# EasyEDA Pro project ProPrj_omb-2024-nano_2026-02-09.epro, board PCB1_5
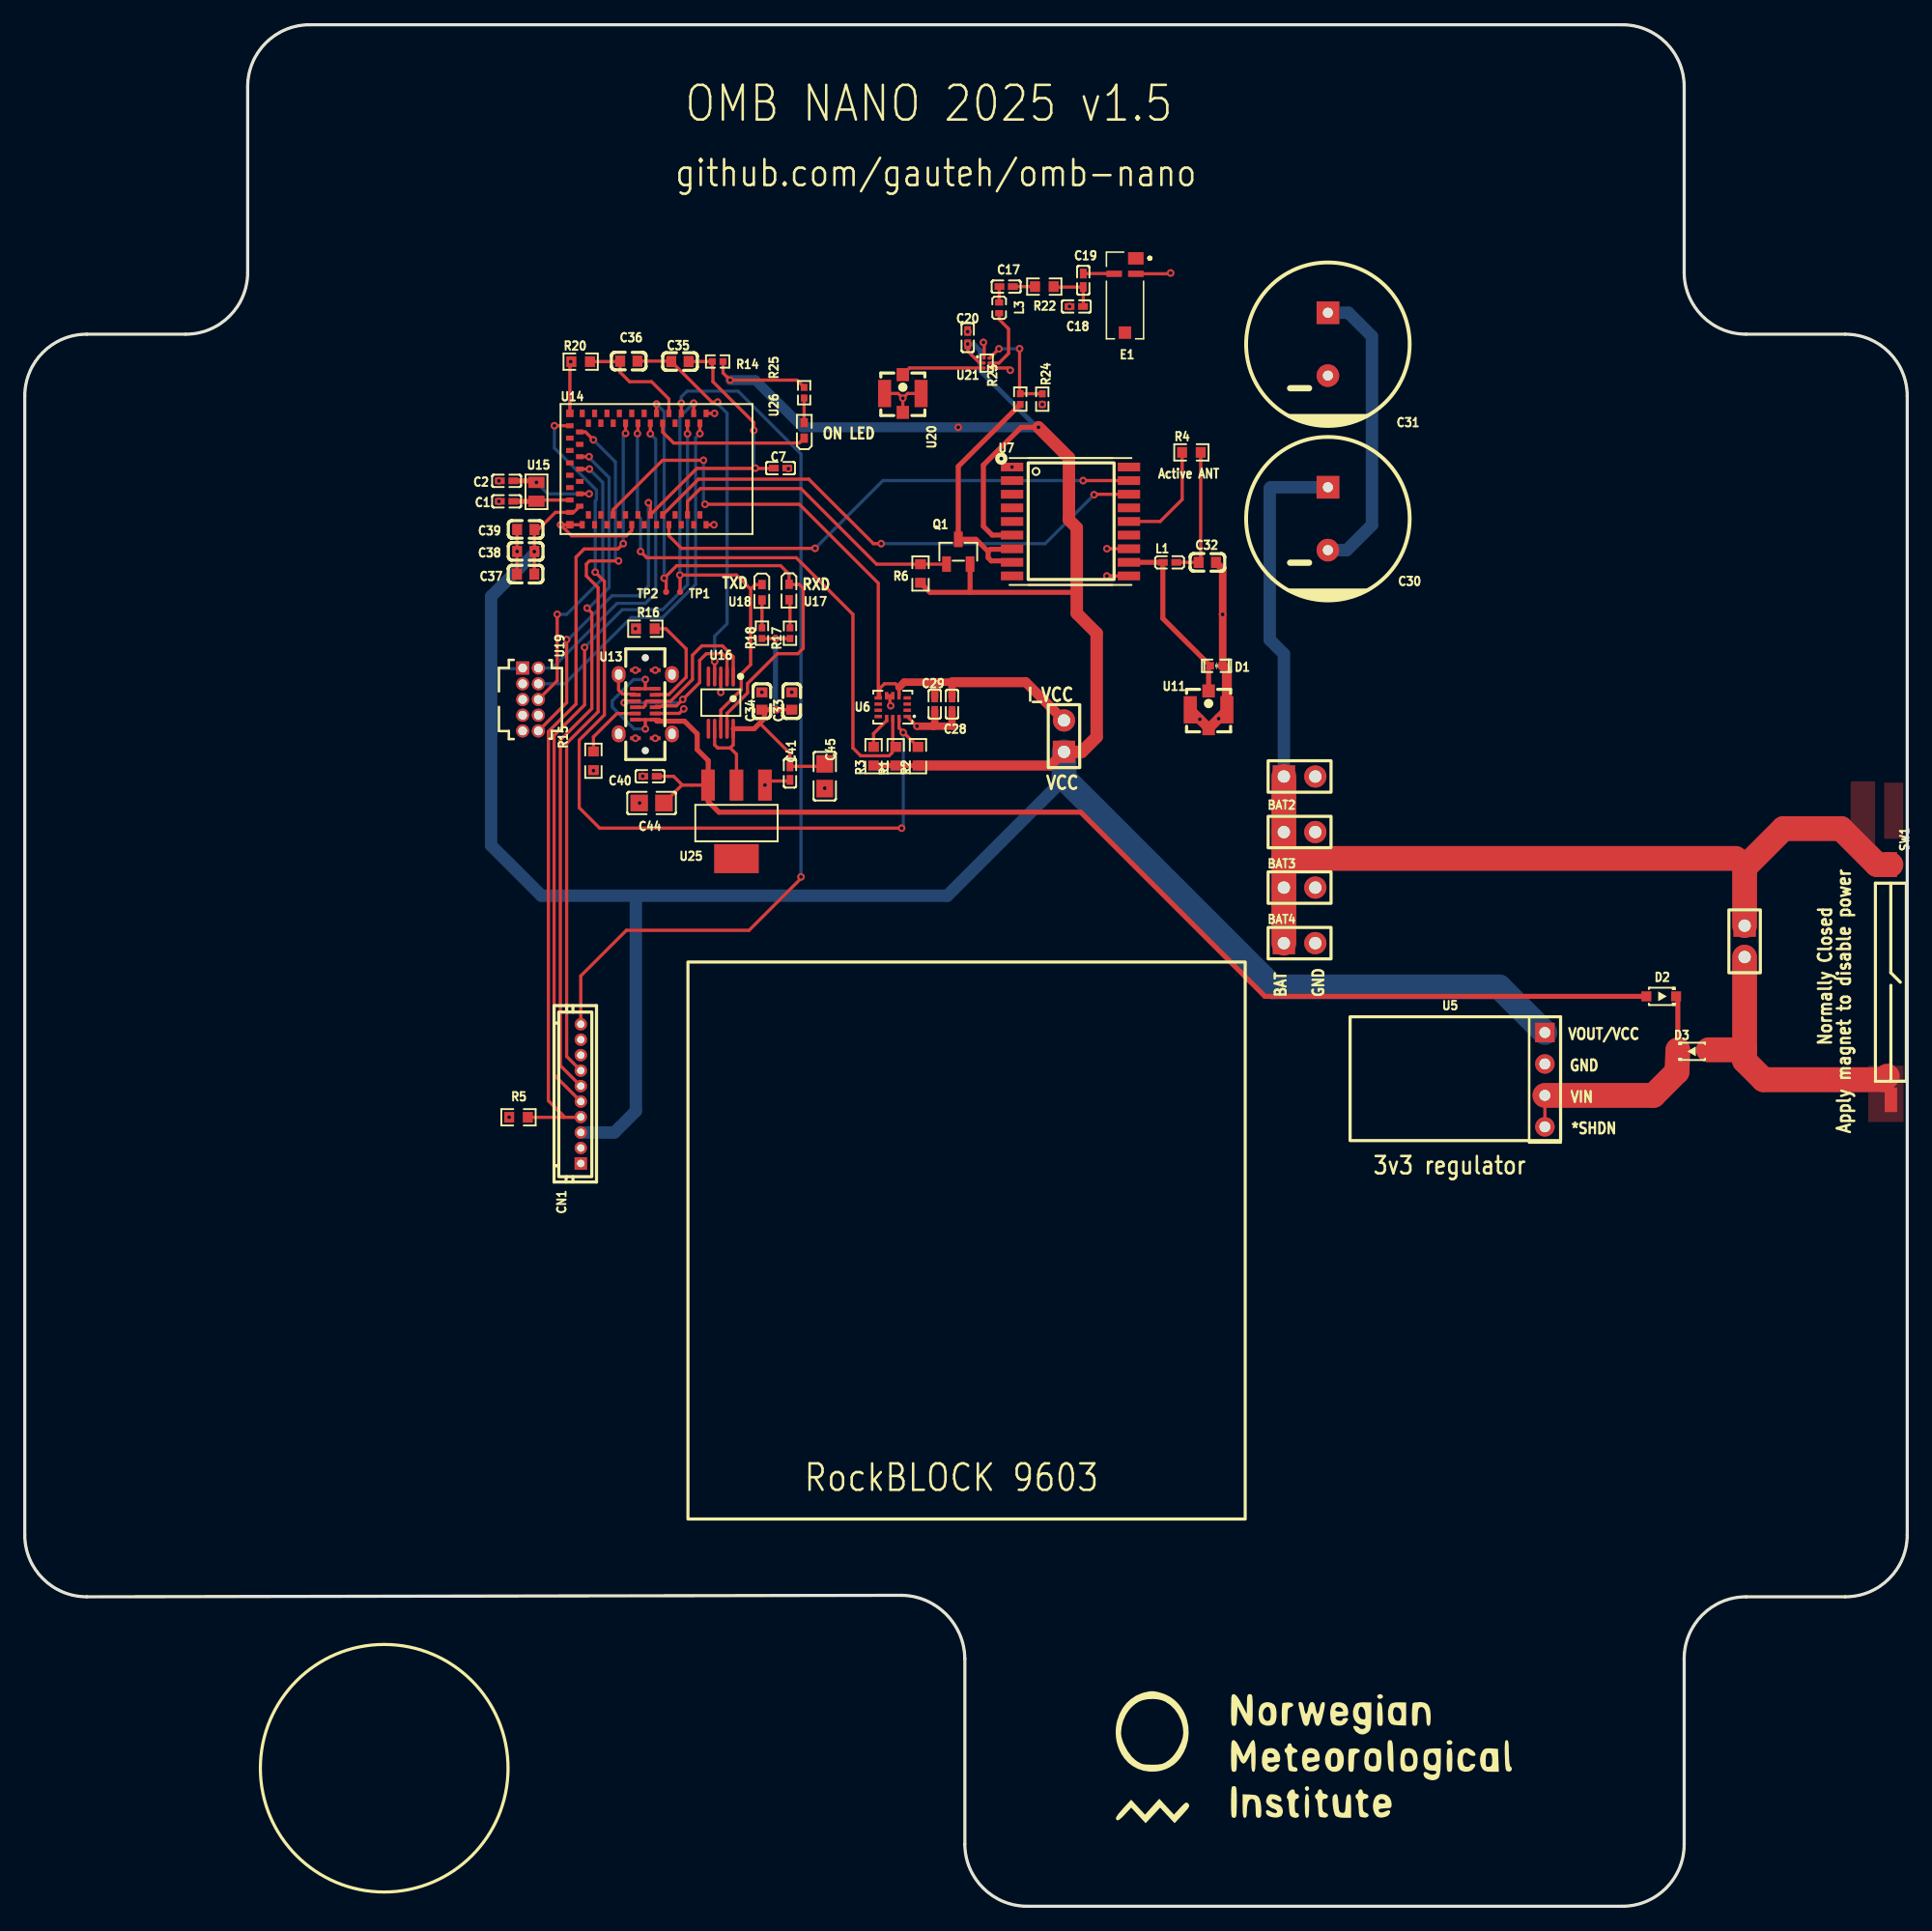
[diagram p19: board, top side]
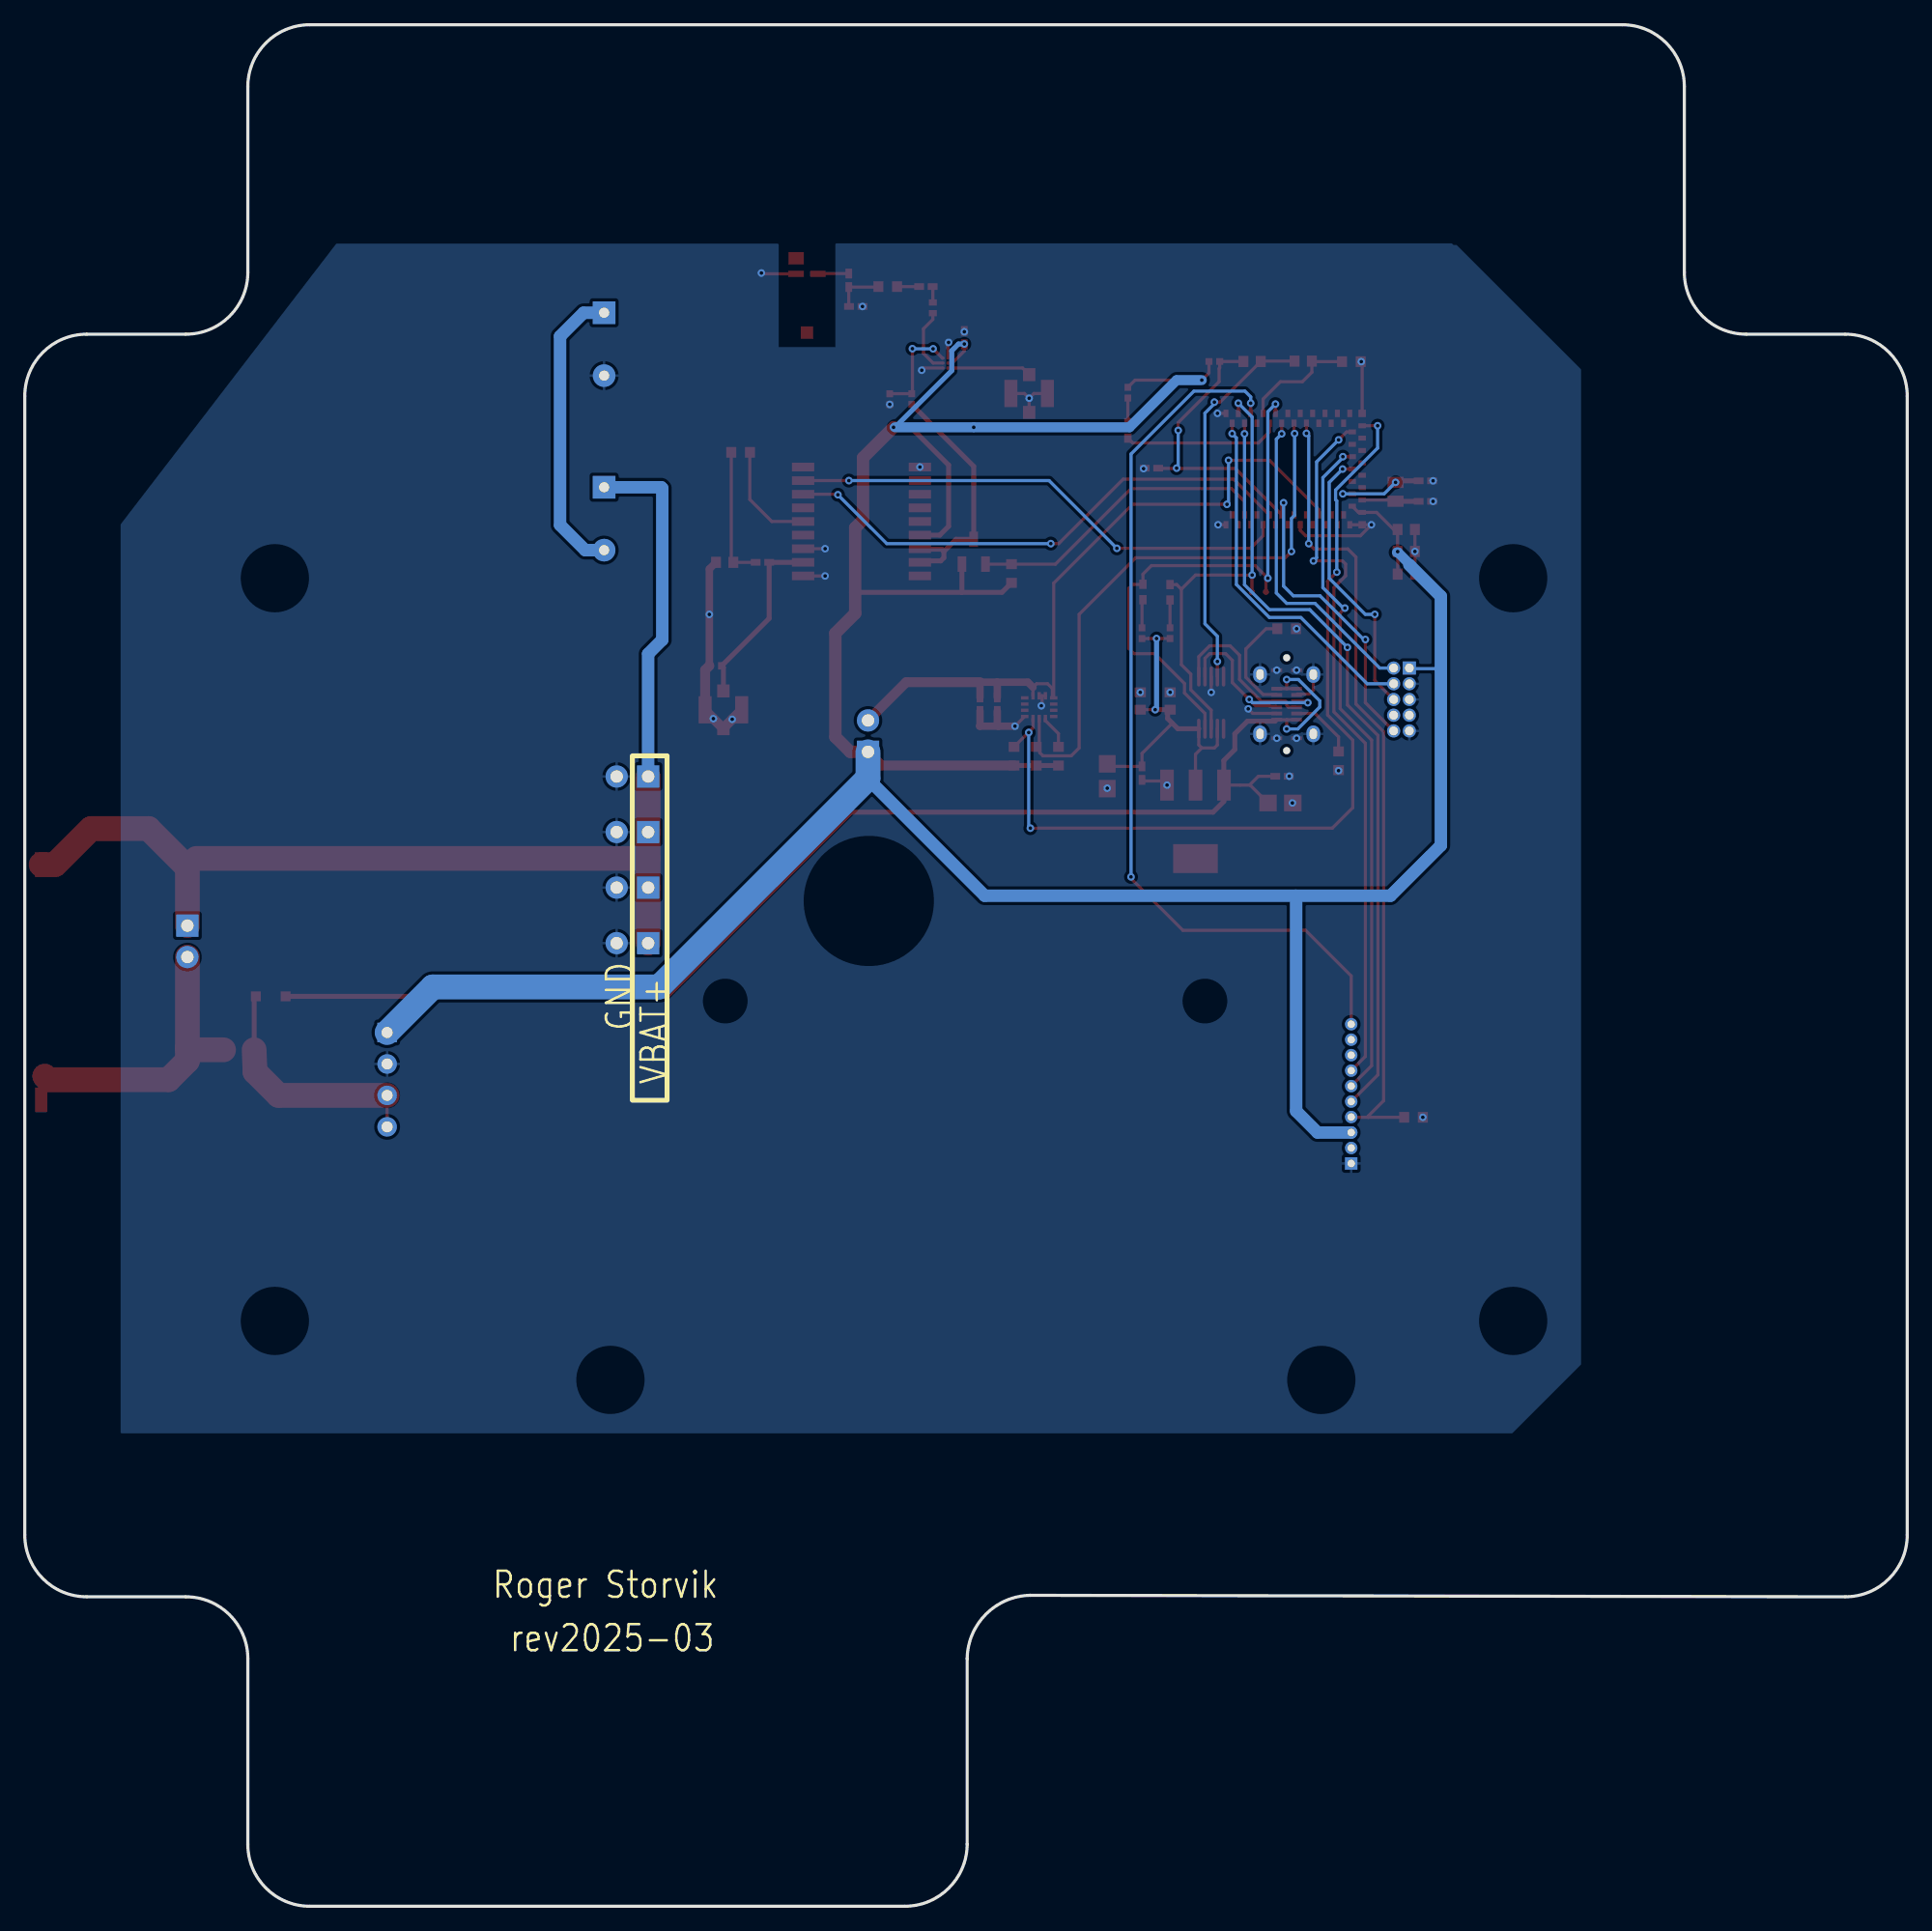
[diagram p20: board, bottom side, seen from below]

Outline 152.01 x 152 mm; copper layers: Top Layer, Bottom Layer. Coordinates in mm from the lower left corner of the outline.
Outline path: 0,122 arc(1.46,125.54) 5,127 13,127 arc(16.54,128.46) 18,132 18,147 arc(19.46,150.54) 23,152 129,152 arc(132.54,150.54) 134,147 134,132 arc(135.46,128.46) 139,127 147.01,127 arc(150.55,125.54) 152.01,122 152.01,30 arc(150.55,26.46) 147.01,25 139,25 arc(135.46,23.54) 134,20 134,5 arc(132.54,1.46) 129,0 80.95,0 arc(77.4,1.46) 75.91,5 75.91,20 arc(74.4,23.59) 70.81,25.12 5,25 arc(1.46,26.46) 0,30 0,122
Stack: Top Layer 0.035mm / Dielectric1 1.51mm FR4 er 4.5 / Bottom Layer 0.035mm

## Design rules (mm)
template: JLCPCB Capability(Two Layers Board)
spacing copperThickness1oz (default): track to track 0.102, other pairs 0.152 to 0.3
spacing copperThickness2oz: track to track 0.203, other pairs 0.152 to 0.3
track width copperThickness1oz (default): min 0.127, default 0.254, max 2.54
track width copperThickness2oz: min 0.203, default 0.254, max 2.54
differential pair differentialPair (default): width min 0.127, default 0.254, max 2.54; gap min 0.152, default 0.152
via viaSize (default): diameter min 0.5, default 0.61, max 10; hole min 0.3, default 0.305, max 6.3

## Placement (name value [footprint] x y rotation side)
BAT1  BAT  [HDR-TH_2P-P2.54-V-M-1]  102.94 91.27 0 top
BAT2  BAT  [HDR-TH_2P-P2.54-V-M-1]  102.94 86.78 0 top
BAT3  BAT  [HDR-TH_2P-P2.54-V-M-1]  102.94 82.29 0 top
BAT4  BAT  [HDR-TH_2P-P2.54-V-M-1]  102.94 77.81 0 top
C1  15pF  [C0402]  38.91 113.5 180 top
C2  15pF  [C0402]  38.91 115.16 180 top
C7  1nF  [C0402]  61.03 116.18 180 top
C17  1nF  [C0402]  79.25 130.85 0 top
C18  4.6pF  [C0402]  84.91 129.24 0 top
C19  1.1pF  [C0402]  85.47 131.36 90 top
C20  1uF  [C0402]  76.14 126.72 270 top
C28  100nF  [C0402]  74.88 97.11 270 top
C29  100nF  [C0402]  73.48 97.11 270 top
C30  10F  [CP_12.5X20MM]  105.23 112.1 180 top
C31  10F  [CP_12.5X20MM]  105.23 126.19 180 top
C32  10nF  [C0603]  95.49 108.57 180 top
C33  0.1uF  [C0603]  61.93 97.37 90 top
C34  10nF  [C0603]  59.52 97.37 90 top
C35  0.1uF  [C0603]  52.91 124.8 180 top
C36  0.1uF  [C0603]  48.78 124.83 0 top
C37  10uF  [C0603]  40.45 107.62 0 top
C38  1uF  [C0603]  40.46 109.45 0 top
C39  0.1uF  [C0603]  40.46 111.23 0 top
C40  100nF  [C0402]  50.49 91.29 180 top
C41  100nF  [C0402]  61.79 91.54 270 top
C44  22uF  [C0805]  50.62 89.13 180 top
C45  22uF  [C0805]  64.6 91.29 270 top
CN1  530471010  [CONN-TH_530471010]  44.9 65.63 90 top
D1  PESD0402-240  [D0402-BI]  96.23 100.21 180 top
D2  PMEG4005EJ,115  [SOD-323_L1.7-W1.3-LS2.5-RD]  132.15 73.51 180 top
D3  PMEG4005EJ,115  [SOD-323_L1.7-W1.3-LS2.5-RD]  134.69 69.06 0 top
E1  -  [NN03-320]  88.85 130.13 90 top
IMUBACKUPPWR1  IMU_BACKUP_PWR  [HDR-TH_2P-P2.54-V-M-1]  83.92 94.53 90 top
L1  27nH  [L0402]  92.45 108.57 0 top
L3  7.5nH  [IND-SMD_L1.0-W0.6]  78.68 129.13 90 top
Q1  DMG2305UX-7  [SOT-23-3_L2.9-W1.3-P1.90-LS2.4-BR]  75.38 109.43 270 top
R1  10K  [R0603]  70.33 92.91 270 top
R2  10K  [R0603]  72.13 92.91 270 top
R3  10K  [R0603]  68.54 92.91 270 top
R4  10  [R0603]  94.21 117.46 0 top
R5  10K  [R0603]  39.87 63.74 180 top
R6  10K  [R0603]  72.33 107.67 90 top
R14  100kΩ  [R0402]  55.95 124.8 0 top
R15  5.1K  [R0603]  45.92 92.54 90 top
R16  5.1K  [R0603]  50.11 103.21 0 top
R17  1K  [R0402]  61.79 102.84 270 top
R18  1K  [R0402]  59.53 102.85 270 top
R20  220K  [R0603]  44.89 124.78 0 top
R22  0Ω  [R0603]  82.33 130.85 0 top
R23  200kΩ  [R0402]  80.39 121.76 270 top
R24  100kΩ  [R0402]  82.17 121.75 90 top
R25  1K  [R0402]  62.93 122.28 90 top
SW1  MK15-B-2-OE  [SW-SMD_L16.0-W2.5-P19.5_MK15-B-2-OE]  150.69 74.65 270 top
SWEN1  SW_EN  [HDR-TH_2P-P2.54-V-M-1]  138.88 77.95 270 top
TP1  -  [Test-Point-0.5mm]  52.92 106.18 0 top
TP2  -  [Test-Point-0.5mm]  51.79 106.18 0 top
U5  -  [HDR-F-2.54_1X4]  122.75 66.78 270 top
U6  ISM330DHCXTR  [LGA-14_L3.0-W2.5-P0.50-BR]  70.09 96.87 0 top
U7  MAX-M10M-00B  [COMM-SMD_L10.1-W9.7-P1.10_GT-1110F2-AGGB]  84.45 111.87 0 top
U11  CONMHF1-SMD-G-T  [RF-SMD_CONMHF1-SMD-G-T]  95.6 96.66 0 top
U13  TYPE-C 16PLT-H10.0  [TYPE-C-SMD_USB4120-03-C]  50.11 97.11 90 top
U14  SPARKFUN ARTEMIS BLE MODULE  [ARTEMIS_BLE]  44.02 120.61 0 top
U15  32.768kHz  [CRYSTAL-SMD_L2.0-W1.2]  41.32 114.27 90 top
U16  CH340E  [MSOP-10_L3.0-W3.0-P0.50-LS5.0-BL]  56.21 97.24 180 top
U17  YLED0402G  [LED0402-R-RD]  61.72 106.17 270 top
U18  YLED0402R  [LED0402-R-RD]  59.53 106.15 270 top
U19  FTSH-105-01-F-D-K  [CONN-TH_10P-P1.27_FTSH-105-01-F-D-K]  40.84 97.49 270 top
U20  CONMHF1-SMD-G-T  [RF-SMD_CONMHF1-SMD-G-T]  70.9 122.21 0 top
U21  BGA725L6E6327FTSA1  [TSLP-6_L1.1-W0.7-P0.40-BR]  77.67 124.67 180 top
U25  AMS1117-3.3  [SOT-223-3_L6.5-W3.4-P2.30-LS7.0-BR]  57.47 87.6 90 top
U26  YLED0402G  [LED0402-R-RD]  62.93 119.23 90 top

## Footprints (pads in the part's own frame, mm; a bottom-side part is the same pattern mirrored in y, then rotated)
ARTEMIS_BLE
  rect 0.4x0.6 smd: 1(11,0) 2(10.5,-0.8) 3(10,0) 4(9.5,-0.8) 5(9,0) 6(8.5,-0.8) 7(8,0) 8(7.5,-0.8) 9(7,0) 10(6.5,-0.8) 11(6,0) 12(5.5,-0.8) 13(5,0) 14(4.5,-0.8) 15(4,0) 16(3.5,-0.8) 17(3,0) 18(2.5,-0.8) 19(2,0) 20(1.5,-0.8) 21(1,0) 39(1,-8.999) 40(1.5,-8.2) 41(2,-8.999) 42(2.5,-8.2) 43(3,-8.999) 44(3.5,-8.2) 45(4,-8.999) 46(4.5,-8.2) 47(5,-8.999) 48(5.5,-8.2) 49(6,-8.999) 50(6.5,-8.2) 51(7,-8.999) 52(7.5,-8.2) 53(8,-8.999) 54(8.5,-8.2) 55(9,-8.999) 56(9.5,-8.2) 57(10,-8.999) 58(10.5,-8.2) 59(11,-8.999)
  rect 0.6x0.6 smd: 22(0,0) 38(0,-8.999)
  rect 0.6x0.4 smd: 23(0,-1) 24(0.8,-1.5) 25(0,-2) 26(0.8,-2.5) 27(0,-2.999) 28(0.8,-3.5) 29(0,-3.999) 30(0.8,-4.5) 31(0,-5) 32(0.8,-5.5) 33(0,-6) 34(0.8,-6.5) 35(0,-7) 36(0.8,-7.5) 37(0,-8)
C0402
  rect 0.79x0.54 smd: 1(-0.545,0) 2(0.545,0)
C0603
  rect 0.8x0.9 smd: 1(-0.7,0) 2(0.7,0)
C0805
  rect 1.41x1.35 smd: 1(-1,0) 2(1,0)
COMM-SMD_L10.1-W9.7-P1.10_GT-1110F2-AGGB
  rect 1.8x0.7 smd: 1(-4.718,4.4) 2(-4.718,3.3) 3(-4.718,2.2) 4(-4.718,1.1) 5(-4.718,0) 6(-4.718,-1.1) 7(-4.718,-2.2) 8(-4.718,-3.3) 9(-4.718,-4.4) 10(4.718,-4.4) 11(4.718,-3.3) 12(4.718,-2.2) 13(4.718,-1.1) 14(4.718,0) 15(4.718,1.1) 16(4.718,2.2) 17(4.718,3.3) 18(4.718,4.4)
CONN-TH_10P-P1.27_FTSH-105-01-F-D-K
  rect 1.06x1.06 hole 0.715x0.71: 1(-2.54,-0.635)
  round 1.06 hole 0.715x0.71: 2(-2.54,0.635) 3(-1.27,-0.635) 4(-1.27,0.635) 5(0,-0.635) 6(0,0.635) 7(1.27,-0.635) 8(1.27,0.635) 9(2.54,-0.635) 10(2.54,0.635)
CONN-TH_530471010
  rect 1x1 hole 0.6: 1(-5.625,0)
  round 1 hole 0.6: 2(-4.375,0) 3(-3.125,0) 4(-1.875,0) 5(-0.625,0) 6(0.625,0) 7(1.875,0) 8(3.125,0) 9(4.375,0) 10(5.625,0)
CP_12.5X20MM
  rect 1.829x1.829 hole 0.813: 1(0,-2.54)
  round 1.829 hole 0.813: 2(0,2.54)
CRYSTAL-SMD_L2.0-W1.2
  rect 0.9x1.3 smd: 1(-0.762,0) 2(0.762,0)
D0402-BI
  rect 0.6x0.6 smd: 1(-0.5,0) 2(0.5,0)
HDR-F-2.54_1X4
  rect 1.575x1.575 hole 0.889: 1(-3.81,0)
  round 1.575 hole 0.889: 2(-1.27,0) 3(1.27,0) 4(3.81,0)
HDR-TH_2P-P2.54-V-M-1
  rect 1.8x1.8 hole 1: 1(-1.27,0)
  round 1.8 hole 1: 2(1.27,0)
IND-SMD_L1.0-W0.6
  rect 0.5x0.648 smd: 1(-0.434,0) 2(0.434,0)
L0402
  rect 0.79x0.54 smd: 1(-0.545,0) 2(0.545,0)
LED0402-R-RD
  rect 0.75x0.6 smd: 1(0.623,0) 2(-0.623,0)
LGA-14_L3.0-W2.5-P0.50-BR
  rect 0.6x0.27 smd: 1(1.17,-0.75) 2(1.17,-0.25) 3(1.17,0.25) 4(1.17,0.75) 8(-1.17,0.75) 9(-1.17,0.25) 10(-1.17,-0.25) 11(-1.17,-0.75)
  rect 0.27x0.6 smd: 5(0.5,0.92) 6(0,0.92) 7(-0.5,0.92) 12(-0.5,-0.92) 13(0,-0.92) 14(0.5,-0.92)
MSOP-10_L3.0-W3.0-P0.50-LS5.0-BL
  oval 0.28x1.62 smd: 1(-1,-2.11) 2(-0.5,-2.11) 3(0,-2.11) 4(0.5,-2.11) 5(1,-2.11) 6(1,2.11) 7(0.5,2.11) 8(0,2.11) 9(-0.5,2.11) 10(-1,2.11)
NN03-320
  rect 1x1 smd: 1(-3,0)
  custom 0.5x1.25 smd: 2(1.75,-0.875) 4(1.75,0.875)
  custom 1x1.25 smd: 3(3,-0.875)
R0402
  rect 0.566x0.54 smd: 1(-0.433,0) 2(0.433,0)
R0603
  rect 0.806x0.864 smd: 1(-0.753,0) 2(0.753,0)
RF-SMD_CONMHF1-SMD-G-T
  rect 1x1.05 smd: 1(0,1.525) 4(0,-1.525)
  rect 1.05x2.2 smd: 2(-1.475,0) 3(1.475,0)
SOD-323_L1.7-W1.3-LS2.5-RD
  rect 0.8x0.8 smd: 1(-1.2,0) 2(1.2,0)
SOT-23-3_L2.9-W1.3-P1.90-LS2.4-BR
  rect 1.25x0.7 smd: 1(1,-0.95) 2(1,0.95) 3(-1,0)
SOT-223-3_L6.5-W3.4-P2.30-LS7.0-BR
  rect 2.5x1.1 smd: 1(2.97,-2.3) 2(2.97,0) 3(2.97,2.3)
  rect 2.34x3.6 smd: 4(-2.97,0)
SW-SMD_L16.0-W2.5-P19.5_MK15-B-2-OE
  rect 2x1 smd: 1(-9.5,0) 2(9.5,0)
Test-Point-0.5mm
  round 0.5 smd: 1(0,0)
TSLP-6_L1.1-W0.7-P0.40-BR
  rect 0.2x0.2 smd: 1(0.2,-0.4) 2(0.2,0) 3(0.2,0.4) 4(-0.2,0.4) 5(-0.2,0) 6(-0.2,-0.4)
TYPE-C-SMD_USB4120-03-C
  oval 1.35x1.1 hole 0.85x0.6: 0(-2.4,2.15) 0(-2.4,-2.15) 0(2.4,2.15) 0(2.4,-2.15)
  rect 0.3x0.87 smd: A1(-2.75,0.8) A4(-1.25,0.8) A5(-0.75,0.8) A6(-0.25,0.8) A7(0.25,0.8) A8(0.75,0.8) A9(1.25,0.8) A12(2.75,0.8) B1(2.75,-0.8) B4(1.25,-0.8) B5(0.75,-0.8) B6(0.25,-0.8) B7(-0.25,-0.8) B8(-0.75,-0.8) B9(-1.25,-0.8) B12(-2.75,-0.8)

## Nets
As in the schematic.

Pads without a net: CN1 2 8 9; E1 1 3; U6 2 3 4 9 10 11; U7 2 3 4 5 9 13 15 18; U14 6 11 13 15 16 17 18 19 20 21 25 26 27 29 31 32 33 40 41 42 43 45 46 48 49 51 54 55 57 58; U16 5 6; U19 7 8; U25 4

## Via types
v1: diameter 0.61, hole 0.305, Top Layer to Bottom Layer, 89 vias

## Routing (per net, layer and track width the routed paths; a pad name or vN(x,y) marks a point on that pad's centre or on a via; arc(x,y) is an arc through that point)
GND: length 64.6
  Top Layer w0.254: U6.7 69.86,97.79 ; 69.86,97.79 U6.6 ; 69.86,97.79 69.86,97.04 v1(69.92,96.98) ; v1(70.9,121.83) U20.4 ; v1(70.9,121.83) 70.52,122.21 U20.2 ; v1(70.9,121.83) 71.29,122.21 U20.3 ; U13.B8 50.92,96.37 52.85,96.37 v1(53.22,96.73) ; v1(79.58,124.09) 79.4,124.27 77.87,124.27 ; v1(87.38,107.47) U7.10 ; R20.1 44.02,124.66 U14.22 ; v1(77.41,126.34) 77.47,126.28 U21.1 ; C37.1 39.75,109.44 v1(39.76,109.45) C39.1 ; U16.3 56.21,98.07 v1(56.2,98.07) ; U13.0 47.95,99.5 47.95,98.27 48.29,97.93 49.24,97.93 U13.A8 ; U14.1 v1(55.7,120.61) ; U14.47 49.02,111.15 48.58,110.72 44.15,110.72 v1(43.27,111.61) U14.38 U14.39 ; v1(87.38,109.67) U7.12 ; 61.81,90.91 60.11,90.91 v1(59.77,90.57) ; v1(92.53,131.95) 92.46,131.88 E1.2 ; v1(55.65,111.61) U14.59 ; v1(72.05,95.33) U6.1
  Top Layer w0.6: C29.2 73.48,95.43 73.39,95.33 ; 73.39,95.33 v1(72.05,95.33) ; 73.39,95.33 74.9,95.33 74.88,95.35 C28.2 ; D1.1 v1(96.73,104.36) 96.73,108.03 C32.1
  Top Layer w0.8: U11.2 v1(94.89,95.89) 95.6,95.18 U11.4 v1(96.41,95.94) 97.07,96.61 U11.3 97.07,99.87 D1.1
  vias: v1(38.29,115.16) v1(38.29,113.5) v1(39.11,63.74) v1(44.09,124.78) v1(45.92,91.74) v1(49.31,103.21) v1(49.31,99.86) v1(49.31,94.36) v1(49.65,89.13) v1(49.9,91.29) v1(50.91,99.86) v1(50.91,94.36) v1(59.52,98.07) v1(61.67,116.14) v1(61.93,98.07) v1(64.6,90.32) v1(76.14,127.2) v1(79.73,116.27) v1(82.17,121.33) v1(84.36,129.24)
VBAT+: length 98.5
  Top Layer w0.254: 138.88,83.92 138.15,84.65
  Top Layer w2: SWEN1.1 138.88,83.92 142.02,87.06 146.66,87.06 149.57,84.15 SW1.1 ; 101.67,84.65 BAT3.1 BAT4.1 ; 101.67,84.65 BAT2.1 BAT1.1 ; 101.67,84.65 138.15,84.65
  Bottom Layer w1: C30.1 100.62,114.64 100.53,114.55 100.53,102.32 101.67,101.17 BAT1.1
VCC: length 280.2
  Top Layer w0.254: U14.36 44.32,112.61 U14.37 42.85,112.61 41.47,111.23 C39.2 C38.2 ; 56.39,124.92 56.39,123.87 v1(56.97,123.29) 62.35,123.29 R25.2 ; C37.2 v1(41.15,109.44) ; C20.2 76.14,125.64 77.12,124.67 U21.2
  Top Layer w0.4: 84.95,106.15 76.34,106.15 ; 76.34,106.15 73.1,106.15 R6.1 ; 76.34,106.15 76.33,106.15 76.33,108.43 ; R2.2 R1.2 R3.2 ; U7.6 78.12,110.77 77.41,111.48 77.41,116.43 80.46,119.48 v1(81.86,119.48)
  Top Layer w0.8: R2.2 82.82,92.16 IMUBACKUPPWR1.1
  Top Layer w1: v1(81.86,119.48) 84.32,117.02 84.32,112 84.95,111.36 84.95,104.45 86.56,102.84 86.56,94.46 85.35,93.26 IMUBACKUPPWR1.1
  Bottom Layer w0.254: U19.1 40.15,99.98 37.66,99.98
  Bottom Layer w0.4: v1(76.14,126.21) 76.61,126.21 77.16,125.66 77.16,124.05 81.73,119.48
  Bottom Layer w0.8: 81.73,119.48 v1(75.38,119.48) 62.81,119.48 59,123.29 v1(56.97,123.29) ; 41.21,109.37 41.13,109.37 40.21,108.45 40.21,108.37
  Bottom Layer w1: 49.38,81.64 49.35,81.6 49.35,64.24 47.62,62.51 CN1.3 ; 49.38,81.64 41.73,81.64 37.66,85.7 37.66,105.82 40.21,108.37 ; 49.38,81.64 74.49,81.64 83.95,91.1
  Bottom Layer w2: U5.1 119.07,74.27 100.78,74.27 83.92,91.13 IMUBACKUPPWR1.1
VCC_CH340: length 28.1
  Top Layer w0.254: 59.35,95.58 61.79,93.13 C41.1 64.39,92.09 C45.1 ; 56.97,93.57 55.95,93.57 55.71,93.81 U16.7 ; 56.97,93.57 57.47,93.06 57.47,91.46 ; 56.97,93.57 57.21,93.81 U16.10 ; R18.2 v1(60.62,102.42) 61.26,102.42 61.27,102.41 R17.2 ; 59.73,96.67 C34.1 ; v1(60.73,96.67) C33.1
  Top Layer w0.4: U16.10 58.9,95.13 59.73,95.95 59.73,96.67 v1(60.73,96.67)
  Bottom Layer w0.4: v1(60.62,102.42) 60.62,96.78 v1(60.73,96.67)
ARTEMIS_RX: length 36.1
  Top Layer w0.254: U18.2 58.99,106.77 58.62,106.4 ; 58.62,106.4 58.62,100.3 57.85,99.54 57.85,98.27 56.21,96.62 U16.8 ; 58.62,106.4 57.47,107.54 v1(52.9,107.54) 52.92,107.53 TP1.1 ; U14.3 v1(54.02,121.43)
  Bottom Layer w0.254: v1(54.02,121.43) 52.9,120.31 v1(52.9,107.54)
ARTEMIS_TX: length 44
  Top Layer w0.254: U16.9 56.71,96.36 58.36,98.02 58.36,98.78 60.78,101.19 62.43,101.19 62.86,101.63 62.86,106.47 62.55,106.78 61.74,106.78 U17.2 61.72,107.61 61.03,108.31 52.65,108.31 v1(51.63,107.29) 51.79,107.13 TP2.1 ; U14.9 v1(51.02,121.36)
  Bottom Layer w0.254: v1(51.02,121.36) 51.63,120.74 v1(51.63,107.29)
BOOT: length 9.3
  Top Layer w0.254: U14.7 52.02,121.76 50.62,123.16 48.84,123.16 48.08,123.93 C36.1 48.03,124.78 R20.2
CC1: length 5.3
  Top Layer w0.254: U13.A5 47.81,96.36 45.92,94.47 R15.2
CC2: length 8.6
  Top Layer w0.254: U13.B5 50.94,97.89 52.01,97.89 53.41,99.29 53.41,101.57 51.78,103.21 R16.2
GPS_SCL: length 40.7
  Top Layer w0.254: v1(85.46,115.17) 89.16,115.17 U7.17 ; v1(63.82,109.7) 53.03,109.7 52.01,110.72 52.01,111.6 U14.53
  Bottom Layer w0.254: v1(63.82,109.7) 69.3,115.17 v1(85.46,115.17)
GPS_SDA: length 42.7
  Top Layer w0.254: U14.52 54.4,115.29 63.32,115.29 68.52,110.08 v1(69.16,110.08) ; U7.16 86.39,114.07 v1(86.35,114.03)
  Bottom Layer w0.254: v1(86.35,114.03) 82.4,110.08 v1(69.16,110.08)
GPS_WAKE: length 24.9
  Top Layer w0.254: Q1.1 74.43,108.42 R6.2 ; U14.56 53.52,113.49 54.55,114.53 62.68,114.53 68.79,108.42 72.31,108.42
I_CS: length 2.7
  Top Layer w0.254: U6.12 69.59,95.79 68.54,94.73 R3.1
I_SCL: length 46.8
  Top Layer w0.254: v1(49.47,118.97) 49.52,119.02 U14.12 ; U6.13 70.09,93.43 70.05,93.38 70.05,93.19 69.79,92.94 67.51,92.94 66.87,93.57 66.87,104.37 62.3,108.94 50.23,108.94 v1(49.73,109.45)
  Bottom Layer w0.254: v1(49.73,109.45) 49.73,112.12 49.47,112.37 v1(49.47,118.97)
I_SDA: length 72.1
  Top Layer w0.254: v1(70.81,87.1) 46.42,87.1 44.77,88.75 44.77,94.21 46.81,96.24 46.81,107.04 v1(46.06,107.78) ; R2.1 70.59,95.2 U6.14 ; U14.23 v1(42.77,119.61)
  Bottom Layer w0.254: v1(46.06,107.78) 46.06,113.53 46.16,113.63 46.16,114.41 42.77,117.8 v1(42.77,119.61) ; v1(70.94,94.82) 70.94,87.23 v1(70.81,87.1)
I_VCC: length 59.4
  Top Layer w0.254: U14.44 47.52,112.83 51.5,116.81 v1(54.81,116.81) ; U6.5 70.59,98.47 70.3,98.76 69.42,98.76 69.03,98.38 69.03,97.73 U6.8 68.92,106.89 62.55,113.26 v1(54.93,113.26)
  Top Layer w0.6: 70.59,98.47 71.01,98.89 73.48,98.89 ; 73.48,98.89 74.87,98.89 74.88,98.89 C28.1 ; 73.48,98.89 73.48,98.89 C29.1
  Top Layer w0.8: IMUBACKUPPWR1.2 80.83,98.89 74.87,98.89
  Bottom Layer w0.254: v1(54.81,116.81) 54.81,113.39 v1(54.93,113.26)
NRESET: length 48
  Top Layer w0.254: v1(58.87,119.23) 58.87,119.86 55.57,123.16 55.57,124.22 55.52,124.27 R14.1 ; C35.1 55.39,124.8 ; U19.10 43.76,97.23 v1(43.76,102.34) ; v1(50.36,113.39) 50.52,113.23 U14.50 54.27,116.16 60.47,116.16 C7.2 ; 55.46,124.86 55.52,124.92
  Bottom Layer w0.254: v1(43.76,102.34) 43.88,102.34 47.42,105.87 49.57,105.87 50.36,106.65 v1(50.36,113.39) ; v1(58.87,119.23) 58.87,116.31 v1(59,116.18)
RB_NETAV: length 57.5
  Top Layer w0.254: v1(45.92,118.47) 45.28,119.11 U14.24 ; v1(47.95,108.69) 45.6,108.69 45.35,108.43 45.35,107.48 46.3,106.53 46.3,96.49 43.76,93.95 43.76,68.65 CN1.7
  Bottom Layer w0.254: v1(45.92,118.47) 47.69,116.69 47.69,108.94 v1(47.95,108.69)
RB_ONOFF: length 65
  Top Layer w0.254: 43.53,63.74 43.53,63.83 42.28,65.07 42.28,94.89 44.52,97.13 44.52,109 45.17,109.65 47.9,109.65 v1(48.33,110.08) ; 43.53,63.74 44.88,63.74 CN1.4 ; 43.53,63.74 R5.1 ; U14.14 48.52,118.99
  Bottom Layer w0.254: v1(48.33,110.08) 48.33,118.8 v1(48.52,118.99)
RB_RI: length 55
  Top Layer w0.254: v1(45.41,104.88) 45.79,104.5 45.79,96.75 43.25,94.21 43.25,67.91 CN1.6 ; U14.28 v1(45.57,117.11)
  Bottom Layer w0.254: v1(45.57,117.11) 45.57,117.03 47.19,115.42 47.19,106.53 45.54,104.88 v1(45.41,104.88)
RB_RX: length 72.5
  Top Layer w0.254: CN1.10 44.9,75.16 48.58,78.84 58.49,78.84 62.68,83.03 v1(62.68,83.16) ; U14.5 v1(53.02,121.43)
  Bottom Layer w0.254: v1(62.68,83.16) 62.68,117.32 57.6,122.4 53.48,122.4 53.02,121.94 v1(53.02,121.43)
RB_TX: length 62.1
  Top Layer w0.254: v1(45.21,101.7) 45.21,97.05 42.74,94.59 42.74,67.17 CN1.5 ; U14.4 v1(53.52,118.96)
  Bottom Layer w0.254: v1(53.52,118.96) 53.52,106.76 51.5,104.75 48.25,104.75 v1(45.21,101.7)
RTS: length 31
  Top Layer w0.254: C36.2 51.98,124.83 52.21,125.05 ; U16.4 v1(55.71,100.56) ; C35.2 55.49,121.51 v1(55.95,121.51)
  Bottom Layer w0.254: v1(55.95,121.51) 55.82,121.51 56.71,120.62 56.71,103.61 55.71,102.6 v1(55.71,100.56)
SWDCLK: length 29.2
  Top Layer w0.254: U14.2 v1(54.52,118.97)
  Bottom Layer w0.254: v1(54.52,118.97) 54.17,118.62 54.17,106.78 51.5,104.11 48.96,104.11 43.61,98.76 U19.4
SWDIO: length 25.9
  Top Layer w0.254: v1(50.52,118.96) U14.10
  Bottom Layer w0.254: U19.2 42.6,100.03 47.82,105.26 50.11,105.26 50.95,106.09 50.95,118.53 v1(50.52,118.96)
SWO: length 22.4
  Top Layer w0.254: U19.6 43,99.01 v1(43,104.37) ; U14.30 v1(45.59,116.11)
  Bottom Layer w0.254: v1(43,104.37) 43.76,104.37 46.68,107.29 46.68,115.02 v1(45.59,116.11)
V_USB: length 110.5
  Top Layer w0.254: 50.09,95.86 50.11,95.84 v1(50.11,95.11) ; 50.09,95.86 U13.B9 ; 50.09,95.86 U13.A4 ; C40.1 52.39,91.29 53.11,90.57 ; v1(50.11,99.1) 50.11,98.36 50.11,98.36 ; 50.11,98.36 U13.B4 ; 50.11,98.36 U13.A9 ; 53.11,90.57 53.06,90.57 C44.1 ; 53.11,90.57 53.87,90.57 53.87,90.57 55.17,90.57 U25.3
  Top Layer w0.3: U13.B9 51.03,95.74
  Top Layer w0.4: 51.03,95.74 53.28,95.74 54.3,94.72 54.3,93.45 55.19,92.56 55.19,89.26 56.05,88.39 85.26,88.39 100.15,73.51 D2.2
  Bottom Layer w0.254: v1(50.11,99.1) 49.16,99.1 47.44,97.38 47.44,96.88 49.2,95.11 v1(50.11,95.11)
XTALI: length 4.6
  Top Layer w0.254: U14.35 41.42,113.61 U15.1
  Top Layer w0.4: C1.1 41.31,113.5 U15.1
XTALO: length 7.3
  Top Layer w0.254: U14.34 v1(45.58,114.11)
  Top Layer w0.4: C2.1 41.19,115.16 v1(41.32,115.03)
  Bottom Layer w0.254: v1(45.58,114.11) 42.24,114.11 v1(41.32,115.03)
$1N2984: length 24
  Bottom Layer w1: C31.1 106.88,128.73 108.79,126.83 108.79,111.59 106.75,109.56 C30.2
$1N5235: length 8.8
  Top Layer w0.254: 93.45,117.46 93.46,117.45 93.46,113.65 91.68,111.87 U7.14
$1N5486: length 14.8
  Top Layer w0.4: U7.11 89.16,108.57 91.9,108.57 91.9,104.04 D1.2 95.6,100.08 U11.1
$1N5497: length 10.8
  Top Layer w0.254: R4.2 94.96,108.74 C32.2 L1.2
$1N22081: length 6.8
  Top Layer w0.254: 70.9,123.76 U20.1 71.44,124.27 U21.3
$1N22083: length 2.5
  Top Layer w0.254: E1.4 87.95,131.9 C19.2
$1N22085: length 5.5
  Top Layer w0.254: L3.1 78.68,128.19 79.44,127.43 79.44,125.45 78.66,124.67 77.87,124.67
$1N22086: length 1.3
  Top Layer w0.254: C17.1 78.68,130.83 78.68,129.57
$1N22087: length 1.8
  Top Layer w0.254: C17.2 R22.1
$1N22088: length 4
  Top Layer w0.254: R22.2 83.12,130.81 C19.1 85.47,129.26 85.45,129.24
$1N22089: length 8.4
  Top Layer w0.254: v1(80.33,125.83) 80.33,122.25 R23.1 82.16,122.19 R24.2 82.04,122.06 ; v1(78.66,125.82) 77.91,125.07 77.87,125.07
  Bottom Layer w0.254: v1(78.66,125.82) 80.32,125.82 v1(80.33,125.83)
$1N29349: length 23.6
  Top Layer w2: 138.88,69.32 138.88,68.3 140.4,66.78 150.12,66.78 150.41,67.06 ; 138.88,69.32 138.75,69.19 135.96,69.19 ; 138.88,69.32 SWEN1.2
$1N29353: length 20.2
  Top Layer w0.254: U5.4 U5.3
  Top Layer w0.4: 133.49,69.19 133.49,73.37 D2.1
  Top Layer w2: U5.3 131.51,65.51 133.42,67.41 133.49,69.19
$1N37399: length 20.4
  Top Layer w0.4: U7.8 79.61,108.69 78.05,108.69 77.79,108.94 77.79,109.45 ; U7.7 79.68,109.63 77.97,109.63 77.79,109.45 ; 77.79,109.45 76.81,110.43 Q1.3 75.38,116.32 R23.2
$2N2050: length 13.2
  Top Layer w0.254: U16.1 57.21,100.95 56.33,101.83 54.68,101.83 53.92,101.07 53.92,99.1 52.15,97.33 50.94,97.33 U13.B6 50.21,97.36 50.11,97.26 50.11,97 49.97,96.86 U13.A6
$2N2057: length 16.1
  Top Layer w0.254: U13.B7 50.98,96.93 51.46,96.93 51.51,96.98 52.62,96.98 v1(53.14,97.5) 54.5,98.86 54.5,100.65 55.04,101.19 56.33,101.19 56.71,100.82 U16.2 ; U13.A7 48.53,97.36 v1(48.4,97.23)
  Bottom Layer w0.254: v1(48.4,97.23) 52.87,97.23 v1(53.14,97.5)
$2N3400: length 2.3
  Top Layer w0.254: U17.1 61.79,105.48 61.79,103.28
$2N3462: length 2.1
  Top Layer w0.254: 59.53,103.45 U18.1
$2N12878: length 12.3
  Top Layer w0.254: 62.69,118.34 62.67,118.34 62.54,118.21 52.39,118.21 51.52,119.09 U14.8
$2N12883: length 2
  Top Layer w0.254: R25.1 U26.1

## Copper pours and planes (outline as drawn; the poured copper is in the pictures)
GND on Bottom Layer: 36.77,134.34 86.56,134.34 86.56,125.96 91.13,125.96 91.13,134.31 126.85,134.31 144.27,111.64 144.27,38.2 31.9,38.2 26.33,43.77 26.33,124.15 36.39,134.21 36.65,134.21
VBAT+ on Top Layer: 147.45,90.88 149.42,90.88 149.42,85.32 147.45,85.32
(no net) on Top Layer: 150.15,90.78 151.68,90.78 151.68,86.23 150.15,86.23
$1N29349 on Top Layer: 148.87,67.9 151.71,67.9 151.71,63.35 148.87,63.35

## Text on the board
Bottom Silkscreen Layer: rev2025-03 | Roger Storvik | VBAT+ | GND
Top Silkscreen Layer: Active ANT | BAT | GND | TXD | RXD | ON LED | VOUT/VCC | VIN | *SHDN | I_VCC | VCC | Normally Closed | Apply magnet to disable power | 3v3 regulator | github.com/gauteh/omb-nano | RockBLOCK 9603 | OMB NANO 2025 v1.5
